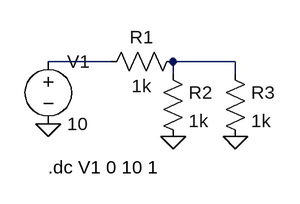
[diagram p0: schematic circuit.asc]
circuit.asc, the LTspice schematic file:
Version 4
SHEET 1 880 680
WIRE 0 16 80 16
WIRE 160 16 240 16
WIRE 160 16 160 32
WIRE 240 16 240 32
FLAG 0 96 0
FLAG 160 112 0
FLAG 240 112 0
SYMBOL voltage 0 0 R0
WINDOW 123 0 0 Left 0
WINDOW 39 0 0 Left 0
SYMATTR InstName V1
SYMATTR Value 10
SYMBOL res 64 32 R270
WINDOW 0 32 56 VTop 2
WINDOW 3 0 56 VBottom 2
SYMATTR InstName R1
SYMATTR Value 1k
SYMBOL res 144 16 R0
SYMATTR InstName R2
SYMATTR Value 1k
SYMBOL res 224 16 R0
SYMATTR InstName R3
SYMATTR Value 1k
TEXT 0 152 Left 2 !.dc V1 0 10 1

The netlist it stands for:
* circuit.asc
V1 N001 0 10
R1 N001 N002 1k
R2 N002 0 1k
R3 N002 0 1k
.dc V1 0 10 1
.backanno
.end